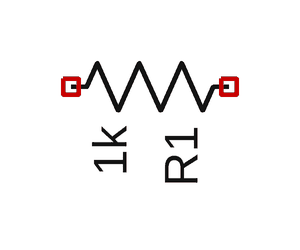
[diagram p0: schematic top.asc]
top.asc, the LTspice schematic file:
Version 4.1
SHEET 1 880 680
SYMBOL res 192 0 R90
SYMATTR InstName R1
SYMATTR Value 1k

The netlist it stands for:
* top.asc
R1 NC_01 NC_02 1k
.backanno
.end